# Altium project Nucleo-144-encoder.PrjPcb
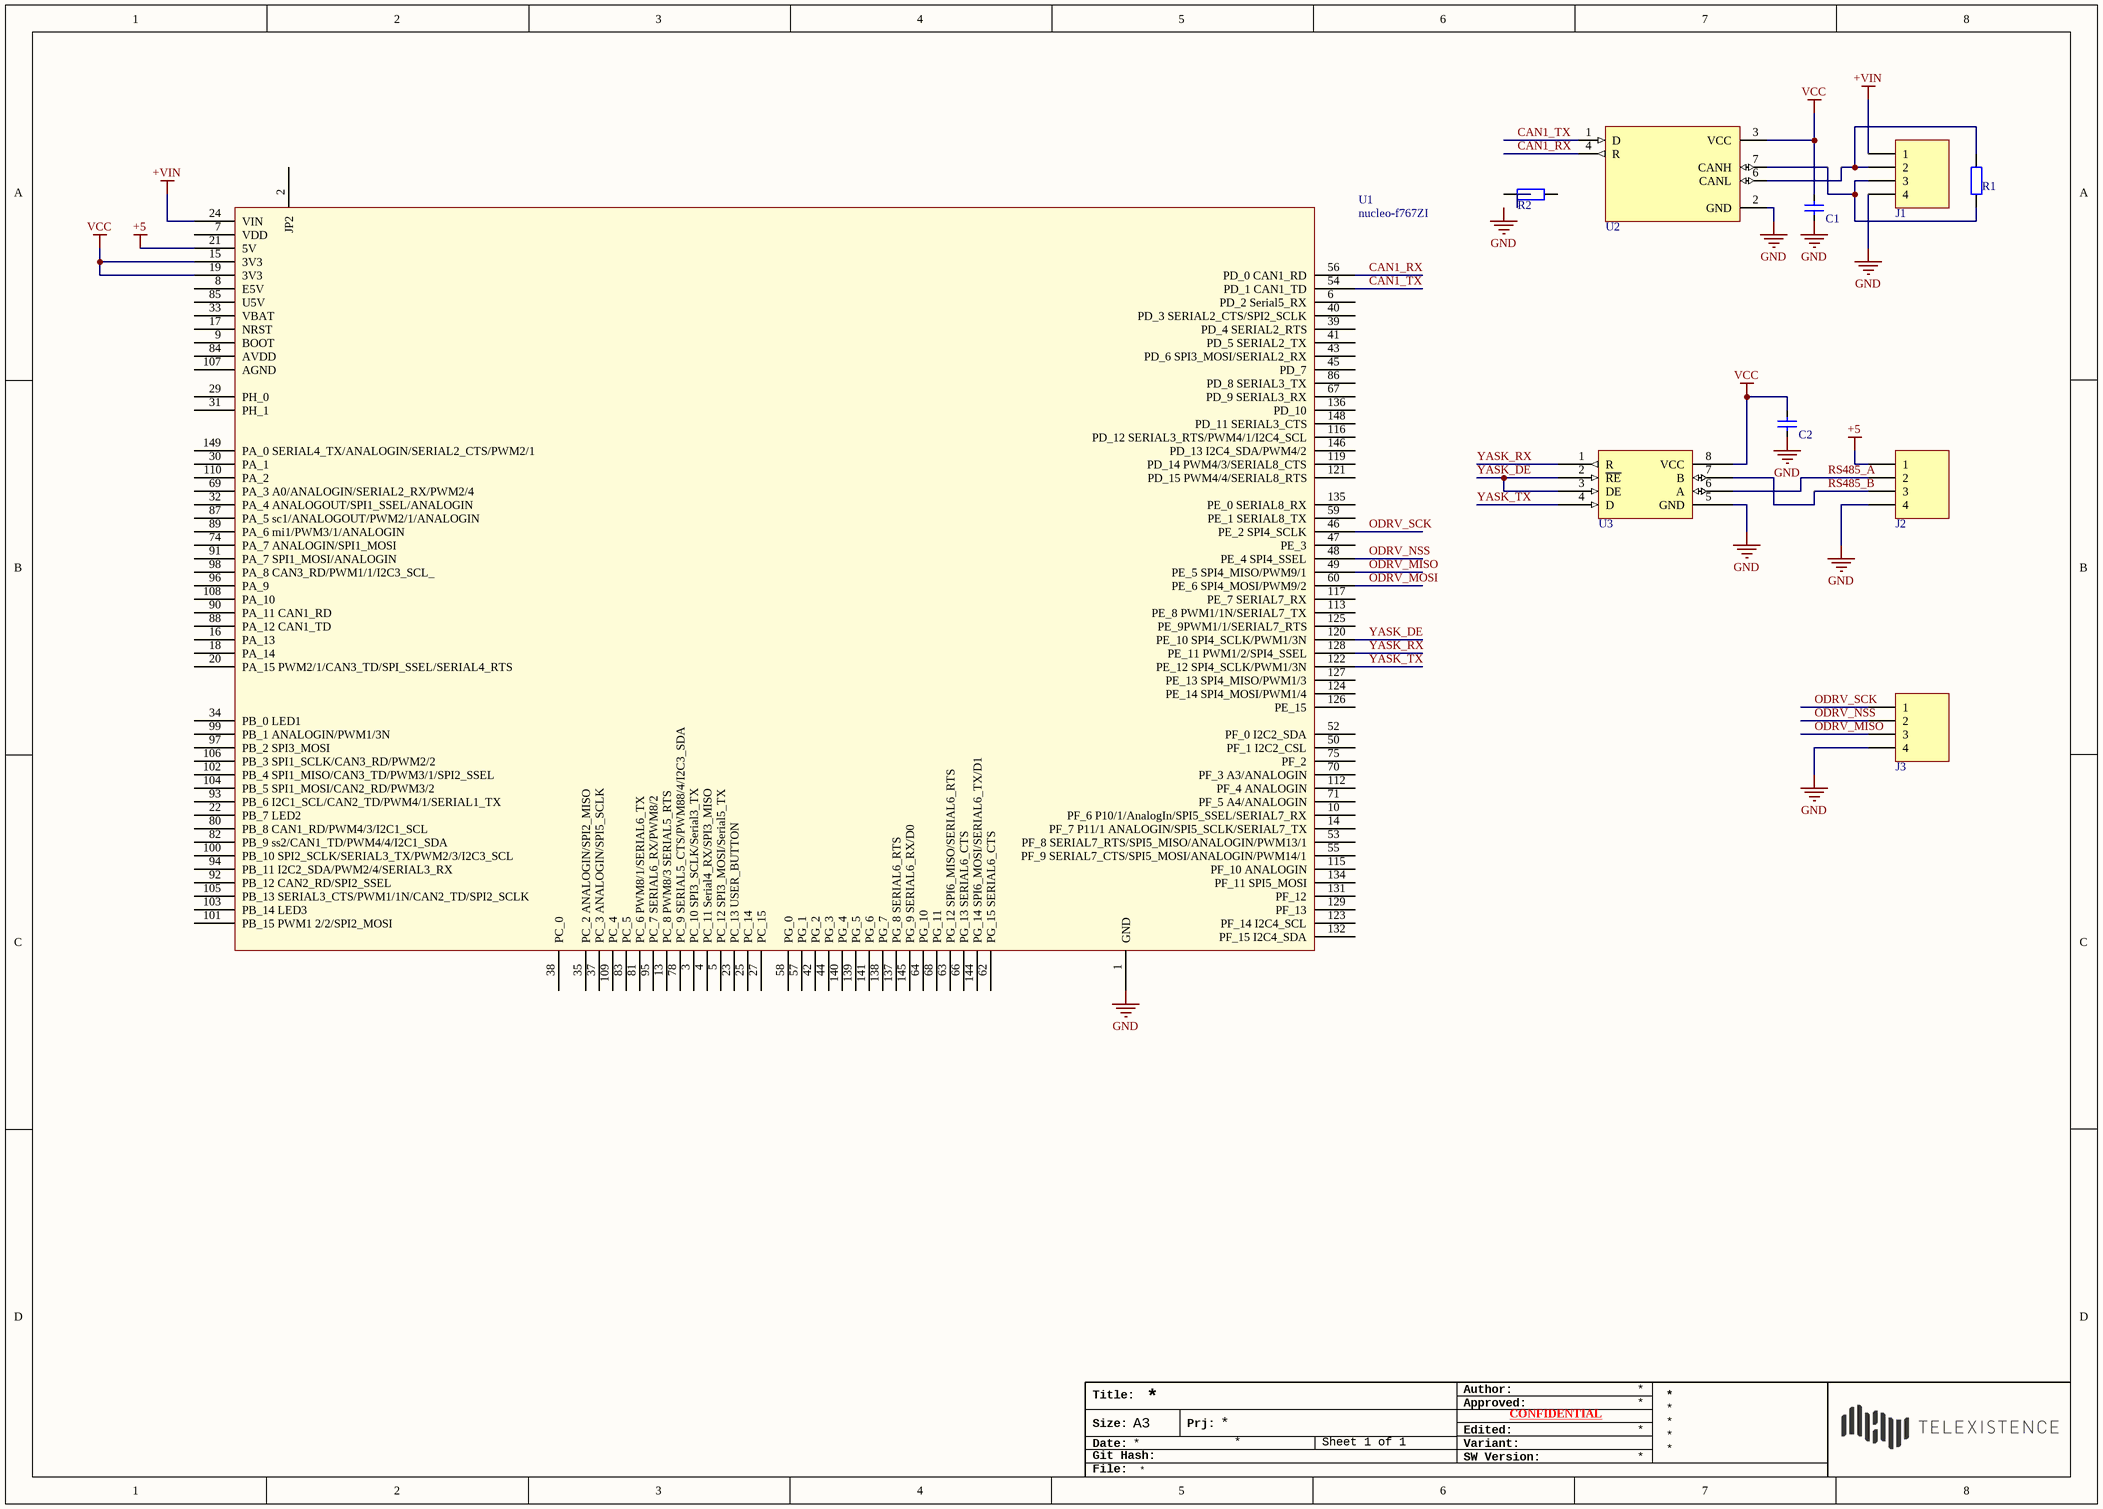
[diagram p0: Main.SchDoc]
1 sheet, 10 parts. Net scope: global (net labels, ports and power ports of the same name join across sheets).
Board file: PCB1.PcbDoc

## Sheet Main.SchDoc
size A3; SheetNumber: 1; SheetTotal: 1

### Parts
C1  100nF  [CAPC1005X06N]  (value not drawn)
C2  100nF  [CAPC1005X06N]  (value not drawn)
J1  S4B-ZR-SM4A-TF  [CONN_S4B-ZR-SM4A-TF_JST]  (value not drawn)
J2  S4B-ZR-SM4A-TF  [CONN_S4B-ZR-SM4A-TF_JST]  (value not drawn)
J3  S4B-ZR-SM4A-TF  [CONN_S4B-ZR-SM4A-TF_JST]  (value not drawn)
R1  100 Ohms  [RESC1005X04N]  (value not drawn)
R2  0 Ohms  [RESC1005X04N]  (value not drawn)
U1  nucleo-f767ZI  [nucleo-144]
U2  SN65HVD232DR  [SOIC127P599X175-8N]  (value not drawn)
U3  THVD1420DR  [SOIC127P600X175-8N]  (value not drawn)

### Nets
+5: J2.1 U1.21(5V)
+VIN: J1.1 U1.24(VIN)
GND: C1.1 C2.1 J1.4 J2.4 J3.4 U1.1(GND) U2.2(GND) U3.5(GND)
VCC: C1.2 C2.2 U1.15(3V3) U1.19(3V3) U2.3(VCC) U3.8(VCC)
CAN1_RX: U1.56(PD_0_CAN1_RD) U2.4(R)
CAN1_TX: U1.54(PD_1_CAN1_TD) U2.1(D)
ODRV_MISO: J3.3 U1.49(PE_5_SPI4_MISO/PWM9/1)
ODRV_MOSI: U1.60(PE_6_SPI4_MOSI/PWM9/2)
ODRV_NSS: J3.2 U1.48(PE_4_SPI4_SSEL)
ODRV_SCK: J3.1 U1.46(PE_2_SPI4_SCLK)
RS485_A: J2.2 U3.6(A)
RS485_B: J2.3 U3.7(B)
YASK_DE: U1.120(PE_10_SPI4_SCLK/PWM1/3N) U3.2(~{RE}) U3.3(DE)
YASK_RX: U1.128(PE_11_PWM1/2/SPI4_SSEL) U3.1(R)
YASK_TX: U1.122(PE_12_SPI4_SCLK/PWM1/3N) U3.4(D)
NetJ1_2: J1.2 R1.2 U2.6(CANL)
NetJ1_3: J1.3 R1.1 U2.7(CANH)

Not connected (* = marked no-connect by the designer): R2 1 2; U1 2(JP2) 3(PC_10_SPI3_SCLK/Serial3_TX) 4(PC_11_Serial4_RX/SPI3_MISO) 5(PC_12_SPI3_MOSI/Serial5_TX) 6(PD_2_Serial5_RX) 7(VDD) 8(E5V) 9(BOOT) 10(PF_6_P10/1/AnalogIn/SPI5_SSEL/SERIAL7_RX) 11(NC) 12(NC) 13(PC_8_PWM8/3_SERIAL5_RTS) 14(PF_7_P11/1_ANALOGIN/SPI5_SCLK/SERIAL7_TX) 16(PA_13) 17(NRST) 18(PA_14) 20(PA_15_PWM2/1/CAN3_TD/SPI_SSEL/SERIAL4_RTS) 22(PB_7_LED2) 23(PC_13_USER_BUTTON) 25(PC_14) 26(NC) 27(PC_15) 29(PH_0) 30(PA_1) 31(PH_1) 32(PA_4_ANALOGOUT/SPI1_SSEL/ANALOGIN) 33(VBAT) 34(PB_0_LED1) 35(PC_2_ANALOGIN/SPI2_MISO) 37(PC_3_ANALOGIN/SPI5_SCLK) 38(PC_0) 39(PD_4_SERIAL2_RTS) 40(PD_3_SERIAL2_CTS/SPI2_SCLK) 41(PD_5_SERIAL2_TX) 42(PG_2) 43(PD_6_SPI3_MOSI/SERIAL2_RX) 44(PG_3) 45(PD_7) 47(PE_3) 50(PF_1_I2C2_CSL) 52(PF_0_I2C2_SDA) 53(PF_8_SERIAL7_RTS/SPI5_MISO/ANALOGIN/PWM13/1) 55(PF_9_SERIAL7_CTS/SPI5_MOSI/ANALOGIN/PWM14/1) 57(PG_1) 58(PG_0) 59(PE_1_SERIAL8_TX) 62(PG_15_SERIAL6_CTS) 63(PG_12_SPI6_MISO/SERIAL6_RTS) 64(PG_10) 65(NC) 66(PG_13_SERIAL6_CTS) 67(PD_9_SERIAL3_RX) 68(PG_11) 69(PA_3_A0/ANALOGIN/SERIAL2_RX/PWM2/4) 70(PF_3_A3/ANALOGIN) 71(PF_5_A4/ANALOGIN) 73(NC) 74(PA_7_ANALOGIN/SPI1_MOSI) 75(PF_2) 78(PC_9_SERIAL5_CTS/PWM88/4/I2C3_SDA) 80(PB_8_CAN1_RD/PWM4/3/I2C1_SCL) 81(PC_6_PWM8/1/SERIAL6_TX) 82(PB_9_ss2/CAN1_TD/PWM4/4/I2C1_SDA) 83(PC_5) 84(AVDD) 85(U5V) 86(PD_8_SERIAL3_TX) 87(PA_5_sc1/ANALOGOUT/PWM2/1/ANALOGIN) 88(PA_12_CAN1_TD) 89(PA_6_mi1/PWM3/1/ANALOGIN) 90(PA_11_CAN1_RD) 91(PA_7_SPI1_MOSI/ANALOGIN) 92(PB_12_CAN2_RD/SPI2_SSEL) 93(PB_6_I2C1_SCL/CAN2_TD/PWM4/1/SERIAL1_TX) 94(PB_11_I2C2_SDA/PWM2/4/SERIAL3_RX) 95(PC_7_SERIAL6_RX/PWM8/2) 96(PA_9) 97(PB_2_SPI3_MOSI) 98(PA_8_CAN3_RD/PWM1/1/I2C3_SCL_) 99(PB_1_ANALOGIN/PWM1/3N) 100(PB_10_SPI2_SCLK/SERIAL3_TX/PWM2/3/I2C3_SCL) 101(PB_15_PWM1_2/2/SPI2_MOSI) 102(PB_4_SPI1_MISO/CAN3_TD/PWM3/1/SPI2_SSEL) 103(PB_14_LED3) 104(PB_5_SPI1_MOSI/CAN2_RD/PWM3/2) 105(PB_13_SERIAL3_CTS/PWM1/1N/CAN2_TD/SPI2_SCLK) 106(PB_3_SPI1_SCLK/CAN3_RD/PWM2/2) 107(AGND) 108(PA_10) 109(PC_4) 110(PA_2) 112(PF_4_ANALOGIN) 113(PE_8_PWM1/1N/SERIAL7_TX) 115(PF_10_ANALOGIN) 116(PD_12_SERIAL3_RTS/PWM4/1/I2C4_SCL) 117(PE_7_SERIAL7_RX) 119(PD_14_PWM4/3/SERIAL8_CTS) 121(PD_15_PWM4/4/SERIAL8_RTS) 123(PF_14_I2C4_SCL) 124(PE_14_SPI4_MOSI/PWM1/4) 125(PE_9PWM1/1/SERIAL7_RTS) 126(PE_15) 127(PE_13_SPI4_MISO/PWM1/3) 129(PF_13) 131(PF_12) 132(PF_15_I2C4_SDA) 134(PF_11_SPI5_MOSI) 135(PE_0_SERIAL8_RX) 136(PD_10) 137(PG_8_SERIAL6_RTS) 138(PG_7) 139(PG_5) 140(PG_4) 141(PG_6) 144(PG_14_SPI6_MOSI/SERIAL6_TX/D1) 145(PG_9_SERIAL6_RX/D0) 146(PD_13_I2C4_SDA/PWM4/2) 148(PD_11_SERIAL3_CTS) 149(PA_0_SERIAL4_TX/ANALOGIN/SERIAL2_CTS/PWM2/1)

### Notes on the sheet
- Labels drawn without touching a wire or pin: GND
- Title:
- Author:
- Approved:
- Size:
- Date:
- Git Hash:
- A3
- Prj:
- SW Version:
- Variant:
- Edited:
- CONFIDENTIAL
- File:

### Library data of the parts
C1 C2 = CGA2B1X7R1C104K050BC: CAP CER 0.1UF 16V X7R 0402; Manufacturer 1: TDK Corporation; Capacitance: 0.1 µF; Tolerance: ±10%; AEC-Q200: True; Part Name: CGA2B1X7R1C104K050BC; Supplier 1: Digi-Key; Supplier Part Number 1: 445-5613-1-ND; Manufacturer Part Number 1: CGA2B1X7R1C104K050BC; Case Code (Imperial): 0402; Voltage Rating: 16V; Mounting Type: Surface Mount, MLCC; Temperature Coefficient: X7R
J1-J3 = S4B-ZR-SM4A-TF: CONN HEADER SMD R/A 4POS 1.5MM; Manufacturer 1: JST Sales America Inc.; Part Name: S4B-ZR-SM4A-TF; Supplier 1: Digi-Key; Supplier Part Number 1: 455-S4B-ZR-SM4A-TFTR-ND; Manufacturer Part Number 1: S4B-ZR-SM4A-TF
R1 = ERJ-2RKF1000X: RES SMD 100 OHM 1% 1/10W 0402; Manufacturer 1: Panasonic Industry; Power (Watts): 0.1W, 1/10W; AEC-Q200: False; Part Name: ERJ-2RKF1000X; Supplier 1: Digi-Key; Supplier Part Number 1: P100LTR-ND; Manufacturer Part Number 1: ERJ-2RKF1000X; Case Code (Imperial): 0402; Resistance: 100 Ohms; Tolerance: ±1%
R2 = ERJ-2GE0R00X: RES SMD 0 OHM JUMPER 1/10W 0402; Manufacturer 1: Panasonic Industry; AEC-Q200: False; Part Name: ERJ-2GE0R00X; Supplier 1: Digi-Key; Supplier Part Number 1: P0.0JTR-ND; Manufacturer Part Number 1: ERJ-2GE0R00X; Case Code (Imperial): 0402; Resistance: 0 Ohms; Power (Watts): -; Tolerance: Jumper
U1 = NUCLEO-144
U2 = SN65HVD232DR: IC TRANSCEIVER HALF 1/1 8SOIC; MF: Texas Instruments; AEC-Q200: False; SnapEDA_Link: https://www.snapeda.com/parts/SN65HVD232DR/Texas+Instruments/view-part/?ref=snap; Package: SOIC-8 Texas Instruments; Value: *; MP: SN65HVD232DR; Check_prices: https://www.snapeda.com/parts/SN65HVD232DR/Texas+Instruments/view-part/?ref=eda; Part Name: SN65HVD232DR; Supplier 1: Digi-Key; Supplier Part Number 1: 296-26344-1-ND; Manufacturer 1: Texas Instruments; Manufacturer Part Number 1: SN65HVD232DR; Function: -; Package / Case: 8-SOIC (0.154", 3.90mm Width); Supplier Device Package: 8-SOIC
U3 = THVD1420DR: IC TRANSCEIVER HALF 1/1 8SOIC; Manufacturer 1: Texas Instruments; AEC-Q200: False; Part Name: THVD1420DR; Supplier 1: Digi-Key; Supplier Part Number 1: 296-THVD1420DRTR-ND; Manufacturer Part Number 1: THVD1420DR; Function: -; Package / Case: 8-SOIC (0.154", 3.90mm Width); Supplier Device Package: 8-SOIC